# Altium schematic sheet Switches.SchDoc
size 406 x 304 mm; SheetNumber: 3; SheetTotal: 8
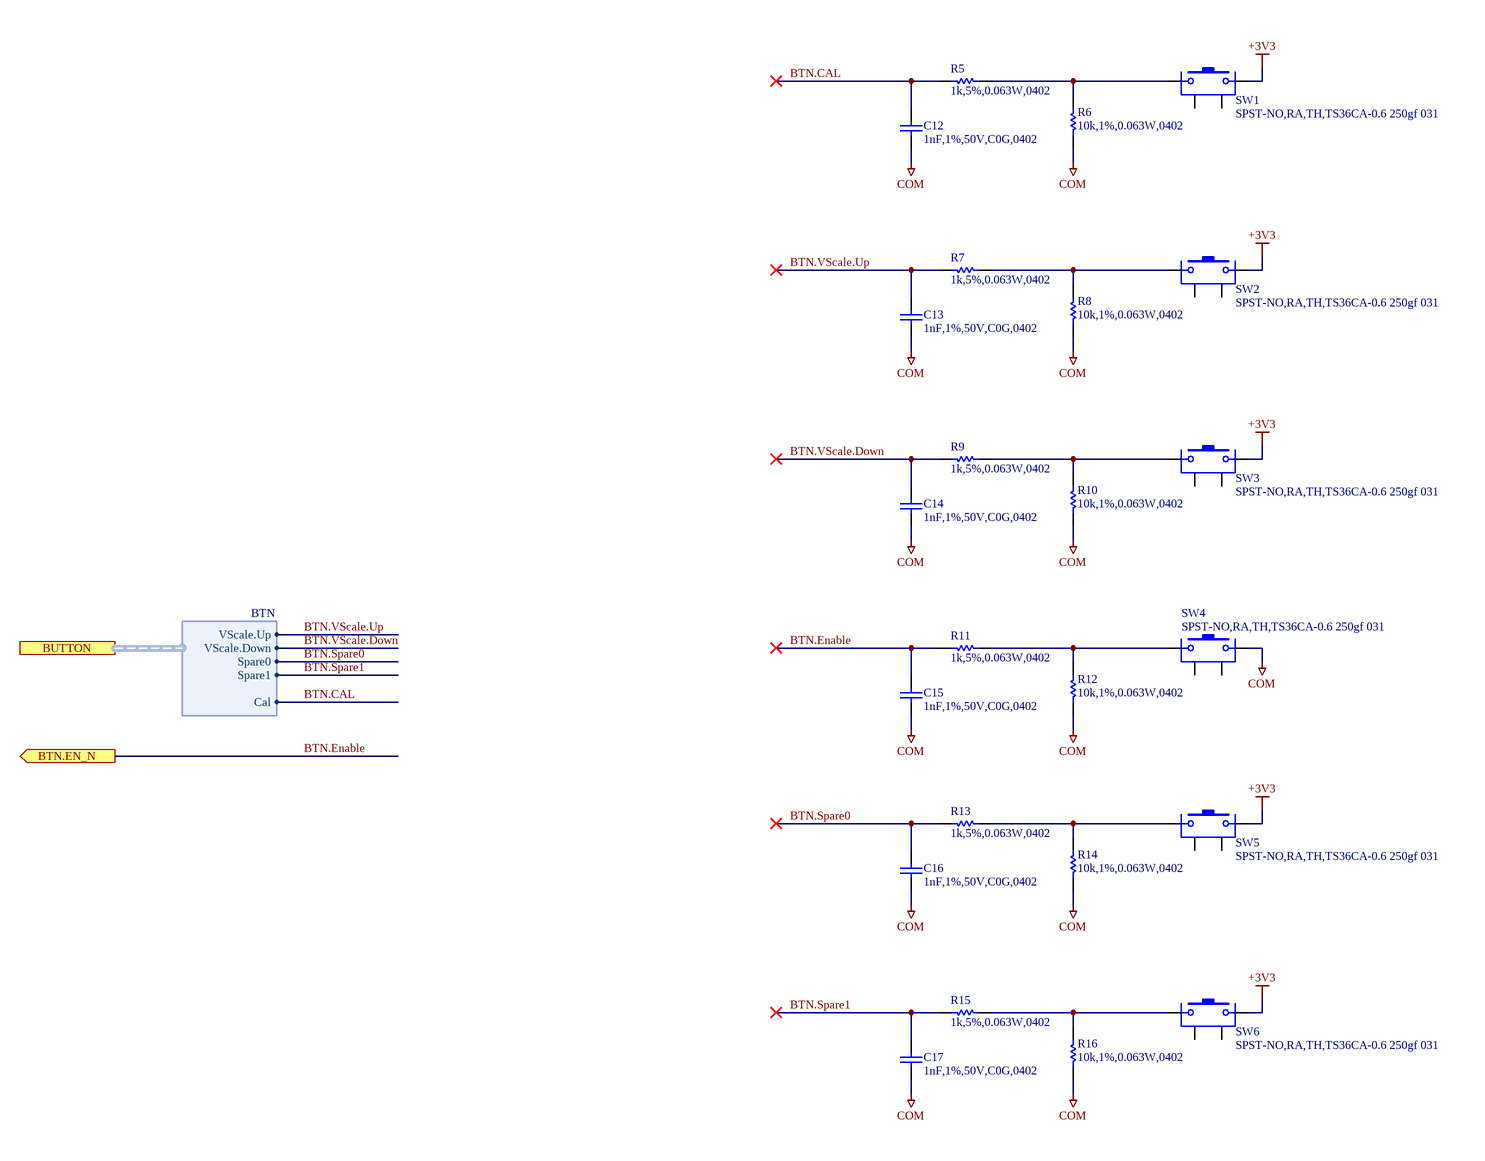
[diagram p0: Switches.SchDoc]

## Parts
C12  1nF,1%,50V,C0G,0402  [CAPC1005X06N]
C13  1nF,1%,50V,C0G,0402  [CAPC1005X06N]
C14  1nF,1%,50V,C0G,0402  [CAPC1005X06N]
C15  1nF,1%,50V,C0G,0402  [CAPC1005X06N]
C16  1nF,1%,50V,C0G,0402  [CAPC1005X06N]
C17  1nF,1%,50V,C0G,0402  [CAPC1005X06N]
R5  1k,5%,0.063W,0402  [RESC1005X04N]
R6  10k,1%,0.063W,0402  [RESC1005X04N]
R7  1k,5%,0.063W,0402  [RESC1005X04N]
R8  10k,1%,0.063W,0402  [RESC1005X04N]
R9  1k,5%,0.063W,0402  [RESC1005X04N]
R10  10k,1%,0.063W,0402  [RESC1005X04N]
R11  1k,5%,0.063W,0402  [RESC1005X04N]
R12  10k,1%,0.063W,0402  [RESC1005X04N]
R13  1k,5%,0.063W,0402  [RESC1005X04N]
R14  10k,1%,0.063W,0402  [RESC1005X04N]
R15  1k,5%,0.063W,0402  [RESC1005X04N]
R16  10k,1%,0.063W,0402  [RESC1005X04N]
SW1  SPST-NO,RA,TH,TS36CA-0.6 250gf 031  [SHOU_HAN_TS36CA-0.6 250gf 031]
SW2  SPST-NO,RA,TH,TS36CA-0.6 250gf 031  [SHOU_HAN_TS36CA-0.6 250gf 031]
SW3  SPST-NO,RA,TH,TS36CA-0.6 250gf 031  [SHOU_HAN_TS36CA-0.6 250gf 031]
SW4  SPST-NO,RA,TH,TS36CA-0.6 250gf 031  [SHOU_HAN_TS36CA-0.6 250gf 031]
SW5  SPST-NO,RA,TH,TS36CA-0.6 250gf 031  [SHOU_HAN_TS36CA-0.6 250gf 031]
SW6  SPST-NO,RA,TH,TS36CA-0.6 250gf 031  [SHOU_HAN_TS36CA-0.6 250gf 031]

## Ports
BTN.EN_N (out), BUTTON (harness BTN)

## Harnesses
BTN: VScale.Up, VScale.Down, Spare1, Cal, Spare0

## Nets
+3V3: SW1.1 SW2.1 SW3.1 SW5.1 SW6.1
COM: C12.1 C13.1 C14.1 C15.1 C16.1 C17.1 R6.1 R8.1 R10.1 R12.1 R14.1 R16.1 SW4.1
BTN.CAL: C12.2 R5.2 ; port BUTTON.Cal
BTN.Enable: C15.2 R11.2 ; port BTN.EN_N
BTN.Spare0: C16.2 R13.2 ; port BUTTON.Spare0
BTN.Spare1: C17.2 R15.2 ; port BUTTON.Spare1
BTN.VScale.Down: C14.2 R9.2 ; port BUTTON.VScale.Down
BTN.VScale.Up: C13.2 R7.2 ; port BUTTON.VScale.Up
NetR5_1: R5.1 R6.2 SW1.2
NetR7_1: R7.1 R8.2 SW2.2
NetR9_1: R9.1 R10.2 SW3.2
NetR11_1: R11.1 R12.2 SW4.2
NetR13_1: R13.1 R14.2 SW5.2
NetR15_1: R15.1 R16.2 SW6.2

Not connected (* = marked no-connect by the designer): SW1 0; SW2 0; SW3 0; SW4 0; SW5 0; SW6 0

## Notes on the sheet
- Sheet Name:
- Date:
- Sheet
- Designer:
- of

## Library data of the parts
C12-C17 = CAP,CER,1nF,1%,50V,C0G,0402: Manufacturer 1: Murata; Manufacturer 1 Part Number: GCM1555C1H102FA16D; Value: 1n; Part Name: CAP,CER,1nF,1%,50V,C0G,0402; CreatedBy: Kevin Heyer; HelpURL: https://pim.murata.com/asset/pim4/ceramicCapacitorSMD/GCM1555C1H102FA16-01A-EN_PDF_CERAMICCAPACITORSMD
R5 R7 R9 R11 R13 R15 = RES,1k,5%,0.063W,0402: 1 kOhms ï¿½5% 0.063W, 1/16W Chip Resistor 0402 (1005 Metric) Automotive AEC-Q200 Thick Film; Manufacturer 1: Stackpole Electronics Inc; Manufacturer 1 Part Number: RMCF0402JT1K00; Vendor 1 Part Number: RMCF0402JT1K00CT-ND; Vendor 1: DIgikey; Part Name: RES,1k,5%,0.063W,0402; CreatedBy: Judd Foster; HelpURL: https://www.seielect.com/catalog/sei-rmcf_rmcp.pdf; Value: 1k
R6 R8 R10 R12 R14 R16 = RES,10k,1%,0.063W,0402: RES 10K OHM 1% 1/16W 0402; Manufacturer 1: Vishay Dale; Manufacturer 1 Part Number: CRCW040210K0FKED; Part Name: RES,10k,1%,0.063W,0402; CreatedBy: Kevin Heyer; HelpURL: https://www.vishay.com/docs/20035/dcrcwe3.pdf; Value: 10k
SW1-SW6 = Switch,Tactile,SPST-NO,RA,TH,TS36CA-0.6 250gf 031: Manufacturer 1: SHOU HAN; Vendor 1 Part Number: C2906288; Vendor 1: LCSC; Part Name: Switch,Tactile,SPST-NO,RA,TH,TS36CA-0.6 250gf 031; CreatedBy: Kevin Heyer; HelpURL: https://www.lcsc.com/datasheet/C2906288.pdf; Manufacturer 1 Part Number: TS36CA-0.6 250gf 031; Value: TS36CA-0.6 250gf 031